# Altium schematic sheet Sheet2.SchDoc: AD8139
size 410 x 297 mm; ApprovedBy: Кубатко В.А.; CheckedBy: Кубатко В.А.; Author: Сергеев Д.А.; CompanyName: ГК "СНАБЖЕНИЕ"; DrawnBy: Сергеев Д.А.; Engineer: Сергеев Д.А.; Organization: ГК "СНАБЖЕНИЕ"; DocumentNumber: ИЛ1338ТО1/1; Revision: 1; SheetNumber: 2; SheetTotal: 2
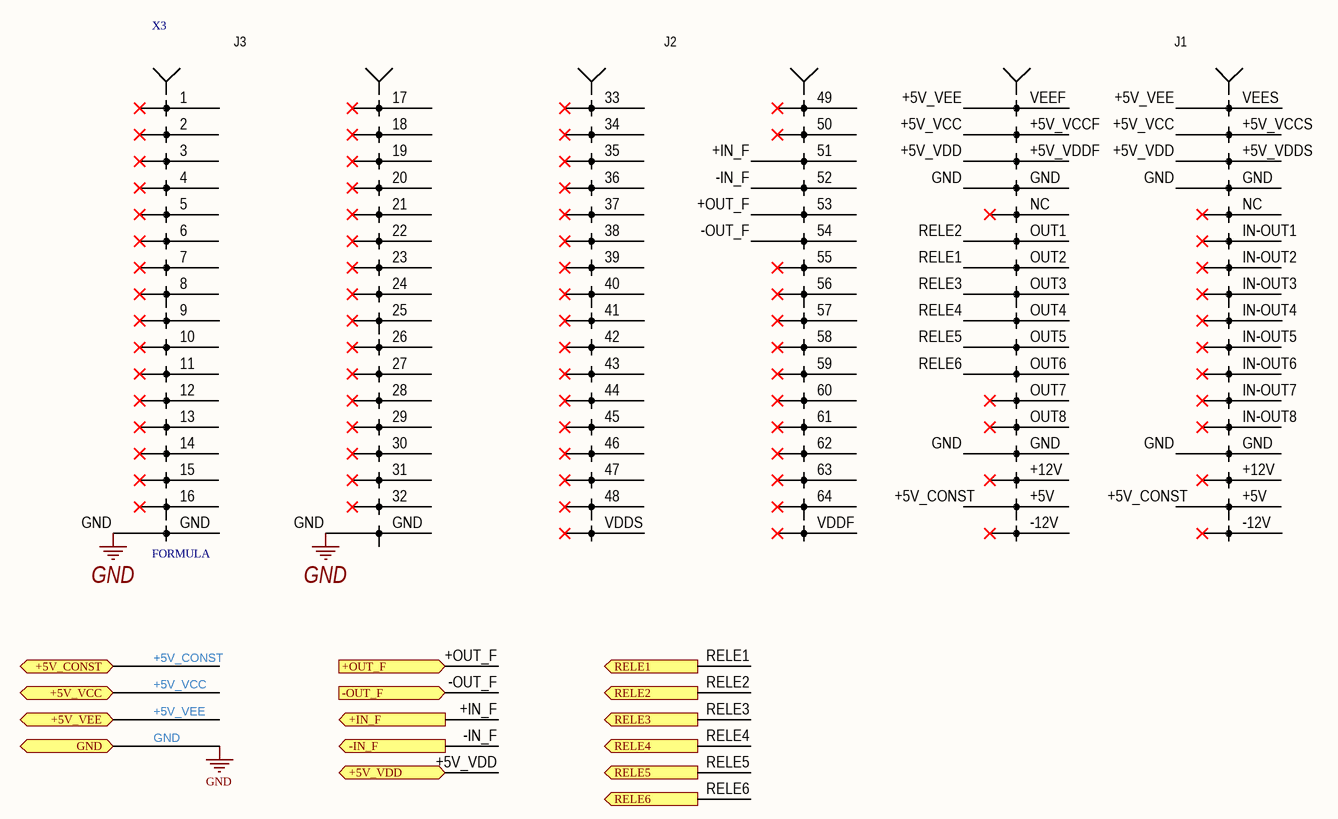
[diagram p0: Sheet2.SchDoc]

## Parts
X3  FORMULA  [FORMULA]

## Ports
+5V_CONST (bidir), +5V_VCC (bidir), +5V_VDD (bidir), +5V_VEE (bidir), +IN_F (out), +OUT_F (in), -IN_F (out), -OUT_F (in), GND (bidir), RELE1 (out), RELE2 (out), RELE3 (out), RELE4 (out), RELE5 (out), RELE6 (out)

## Nets
GND: X3.GND ; port GND
+5V_CONST: X3.+5V ; port +5V_CONST
+5V_VCC: X3.+5V_VCCF(VCCF) X3.+5V_VCCS(VCCS) ; port +5V_VCC
+5V_VDD: X3.+5V_VDDF(VDDF) X3.+5V_VDDS(VDDS) ; port +5V_VDD
+5V_VEE: X3.VEEF X3.VEES ; port +5V_VEE
+IN_F: X3.51 ; port +IN_F
+OUT_F: X3.53 ; port +OUT_F
-IN_F: X3.52 ; port -IN_F
-OUT_F: X3.54 ; port -OUT_F
RELE1: X3.OUT2 ; port RELE1
RELE2: X3.OUT1 ; port RELE2
RELE3: X3.OUT3 ; port RELE3
RELE4: X3.OUT4 ; port RELE4
RELE5: X3.OUT5 ; port RELE5
RELE6: X3.OUT6 ; port RELE6

Not connected (* = marked no-connect by the designer): X3 1* 2* 3* 4* 5* 6* 7* 8* 9* 10* 11* 12* 13* 14* 15* 16* 17* 18* 19* 20* 21* 22* 23* 24* 25* 26* 27* 28* 29* 30* 31* 32* 33* 34* 35* 36(4)* 37(5)* 38* 39* 40* 41* 42* 43* 44* 45* 46* 47* 48* 49* 50* 55* 56* 57* 58* 59* 60* 61* 62* 63* 64* +12V* -12V* IN-OUT1* IN-OUT2* IN-OUT3* IN-OUT4* IN-OUT5* IN-OUT6* IN-OUT7* IN-OUT8* NC* OUT7* OUT8* VDDF* VDDS*

## Notes on the sheet
- Перв. примен.
- Справ. №
- Подп. и дата
- Инв. № дубл.
- Взам. инв. №
- Разраб.
- Изм.
- Лист
- № докум.
- Подп.
- Дата
- Литера
- Масса
- Масштаб
- Пров.
- Т.контр.
- Листов
- Инв. № подл.
- Н.контр.
- Утв.
- Форма 1 ГОСТ 2.104-2006
- Копировал
- Формат А3
- (in symbol FORMULA) J3; J2; J1